# Altium schematic sheet U_Mass_Storage.SchDoc
size A4; SheetNumber: 3; SheetTotal: 7
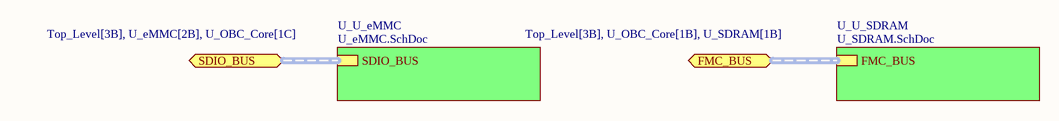
[diagram p0: U_Mass_Storage.SchDoc]

## Sub-sheets
U_U_eMMC = U_eMMC.SchDoc: SDIO_BUS (harness SDIO_BUS_TYPE)
U_U_SDRAM = U_SDRAM.SchDoc: FMC_BUS (harness FMC_BUS_TYPE)

## Ports
FMC_BUS (bidir, harness FMC_BUS_TYPE, see Top_Level[3B], U_OBC_Core[1B], U_SDRAM[1B]), SDIO_BUS (bidir, harness SDIO_BUS_TYPE, see Top_Level[3B], U_eMMC[2B], U_OBC_Core[1C])

## Buses and harness runs
harness port FMC_BUS = sheet U_U_SDRAM/FMC_BUS
harness port SDIO_BUS = sheet U_U_eMMC/SDIO_BUS